# Altium schematic sheet Main.SchDoc
size A4; SheetNumber: 1; SheetTotal: 3
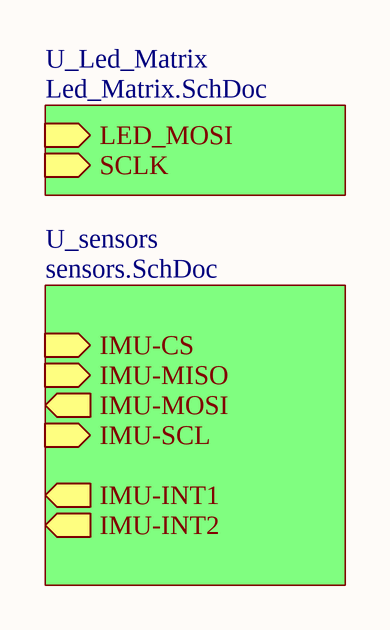
[diagram p0: Main.SchDoc]

## Sub-sheets
U_Led_Matrix = Led_Matrix.SchDoc: LED_MOSI (in), SCLK (in)
U_sensors = sensors.SchDoc: IMU-INT2 (out), IMU-INT1 (out), IMU-SCL (in), IMU-MOSI (out), IMU-MISO (in), IMU-CS (in)